# Altium schematic sheet 200_CONEXIONES.SchDoc: MACETA INTELIGENTE
size A4; DrawnBy: ALEXIS VALENCIA; SheetNumber: 4; SheetTotal: 4
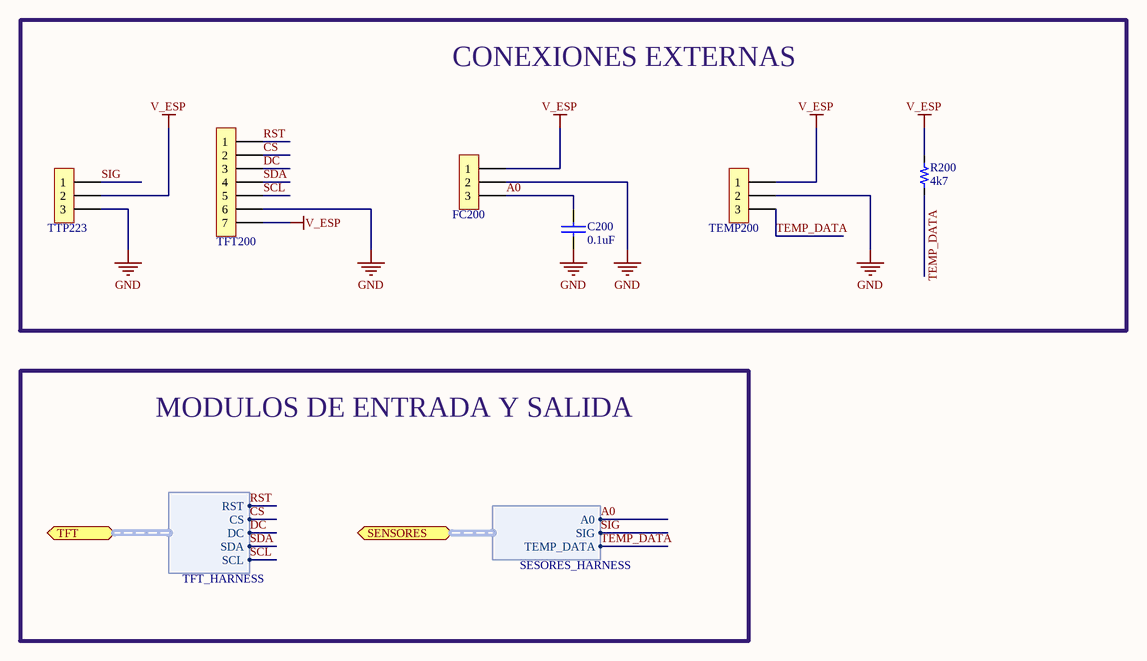
[diagram p0: 200_CONEXIONES.SchDoc]

## Parts
C200  value 0.1uF  [0603_cap]  (hidden comment: 0.1uF 50V)
FC200  3x1  [H_3X1_TH_100mil]  (value not drawn)  (no BOM)
R200  value 4k7  [0603_res]  (hidden comment: 4k7 1/10W)
TEMP200  3x1  [H_3X1_TH_100mil]  (value not drawn)  (no BOM)
TFT200  7x1  [H_7x1_TH_100mil]  (value not drawn)  (no BOM)
TTP223  3x1  [H_3X1_TH_100mil]  (value not drawn)  (no BOM)

## Blocks framed on the sheet
CONEXIONES EXTERNAS: C200 FC200 R200 TEMP200 TFT200 TTP223

## Ports
SENSORES (bidir, harness SESORES_HARNESS), TFT (bidir, harness TFT_HARNESS)

## Harnesses
TFT_HARNESS: RST, CS, DC, SDA, SCL
SESORES_HARNESS: A0, SIG, TEMP_DATA

## Nets
GND: C200.2 FC200.2 TEMP200.2 TFT200.6 TTP223.3
V_ESP: FC200.1 R200.1 TEMP200.1 TFT200.7 TTP223.2
A0: C200.1 FC200.3 ; port SENSORES.A0
CS: TFT200.2 ; port TFT.CS
DC: TFT200.3 ; port TFT.DC
RST: TFT200.1 ; port TFT.RST
SCL: TFT200.5 ; port TFT.SCL
SDA: TFT200.4 ; port TFT.SDA
SIG: TTP223.1 ; port SENSORES.SIG
TEMP_DATA: R200.2 TEMP200.3 ; port SENSORES.TEMP_DATA

## Notes on the sheet
- MODULOS DE ENTRADA Y SALIDA

## Library data of the parts
C200 = Cap_0.1uF_0603_50V: 50V 100nF Y5V -20%~+80% 0603 Multilayer Ceramic Capacitors MLCC - SMD/SMT ROHS; Manufacturer: Walsin Tech Corp; Manufacturer Part Number: 0603F104Z500CT; Supplier 1: LCSC; Supplier Part Number 1: C83060; ComponentLink1Description: LCSC; ComponentLink1URL: https://www.lcsc.com/product-detail/Multilayer-Ceramic-Capacitors-MLCC-SMD-SMT_Walsin-Tech-Corp-0603F104Z500CT_C83060.html
FC200 TEMP200 TTP223 = H_Male_3x1_TH_100mil: ComponentLink1Description: LCSC
R200 = Res_4k7_0603_1/10W: 100mW Thick Film Resistor 75V ±1% 4.7kΩ 0603 Chip Resistor - Surface Mount ROHS; Manufacturer: VO; Manufacturer Part Number: SCR0603F4K7; ComponentLink1URL: https://lcsc.com/product-detail/Chip-Resistor-Surface-Mount_VO-SCR0603F4K7_C3016318.html; Supplier 1: LCSC; Supplier Part Number 1: C3016318; ComponentLink1Description: LCSC
TFT200 = H_Male_7x1_TH_100mil: ComponentLink1Description: LCSC